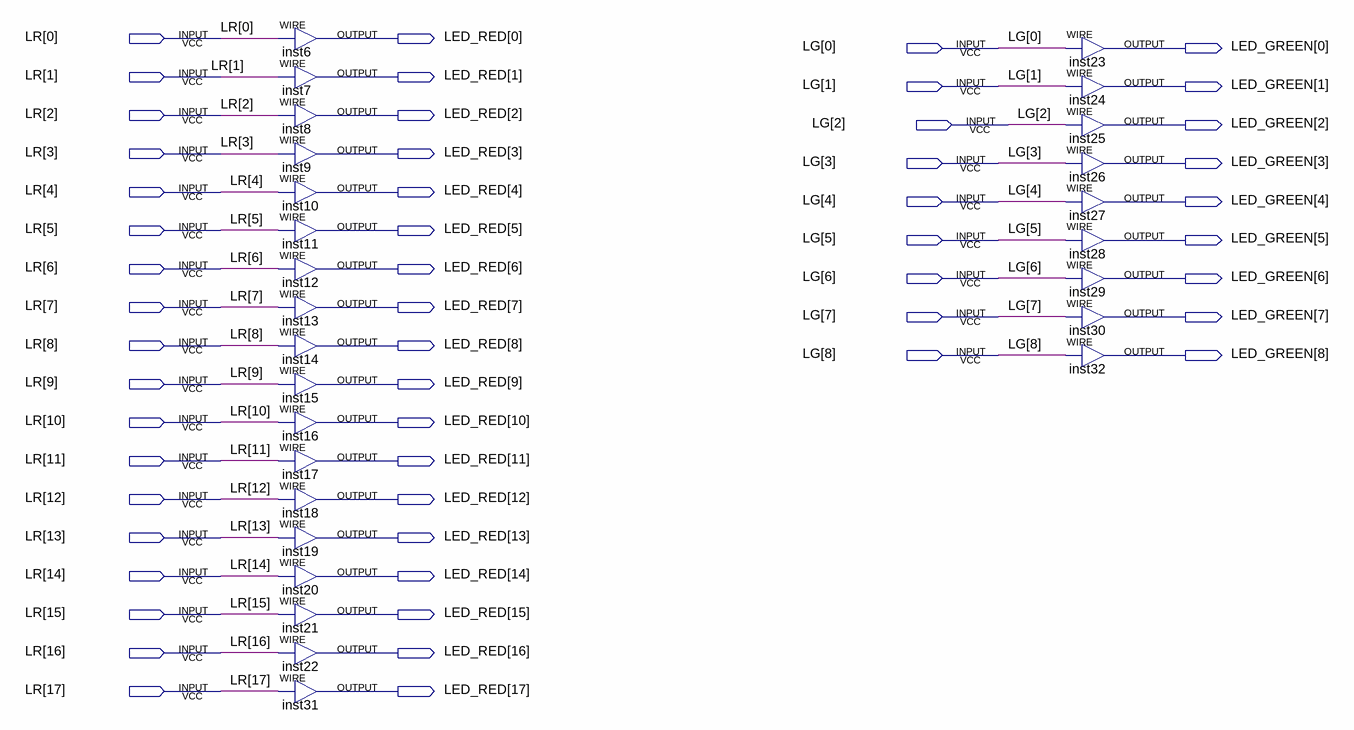
[diagram p0: schematic sheet]
// Quartus schematic LEDS.bdf as structural Verilog: 27 symbols, 54 pins
module LEDS (
  input  [17:0] LR,
  input  [8:0] LG,
  output [17:0] LED_RED,
  output [8:0] LED_GREEN
);

  assign LED_RED[0] = LR[0];  // WIRE inst6
  assign LED_RED[1] = LR[1];  // WIRE inst7
  assign LED_RED[2] = LR[2];  // WIRE inst8
  assign LED_RED[3] = LR[3];  // WIRE inst9
  assign LED_RED[4] = LR[4];  // WIRE inst10
  assign LED_RED[5] = LR[5];  // WIRE inst11
  assign LED_RED[6] = LR[6];  // WIRE inst12
  assign LED_RED[7] = LR[7];  // WIRE inst13
  assign LED_RED[8] = LR[8];  // WIRE inst14
  assign LED_RED[9] = LR[9];  // WIRE inst15
  assign LED_RED[10] = LR[10];  // WIRE inst16
  assign LED_RED[11] = LR[11];  // WIRE inst17
  assign LED_RED[12] = LR[12];  // WIRE inst18
  assign LED_RED[13] = LR[13];  // WIRE inst19
  assign LED_RED[14] = LR[14];  // WIRE inst20
  assign LED_RED[15] = LR[15];  // WIRE inst21
  assign LED_RED[16] = LR[16];  // WIRE inst22
  assign LED_RED[17] = LR[17];  // WIRE inst31
  assign LED_GREEN[0] = LG[0];  // WIRE inst23
  assign LED_GREEN[1] = LG[1];  // WIRE inst24
  assign LED_GREEN[2] = LG[2];  // WIRE inst25
  assign LED_GREEN[3] = LG[3];  // WIRE inst26
  assign LED_GREEN[4] = LG[4];  // WIRE inst27
  assign LED_GREEN[5] = LG[5];  // WIRE inst28
  assign LED_GREEN[6] = LG[6];  // WIRE inst29
  assign LED_GREEN[7] = LG[7];  // WIRE inst30
  assign LED_GREEN[8] = LG[8];  // WIRE inst32
endmodule
